# Altium schematic sheet 灯带消消乐.SchDoc
size A2
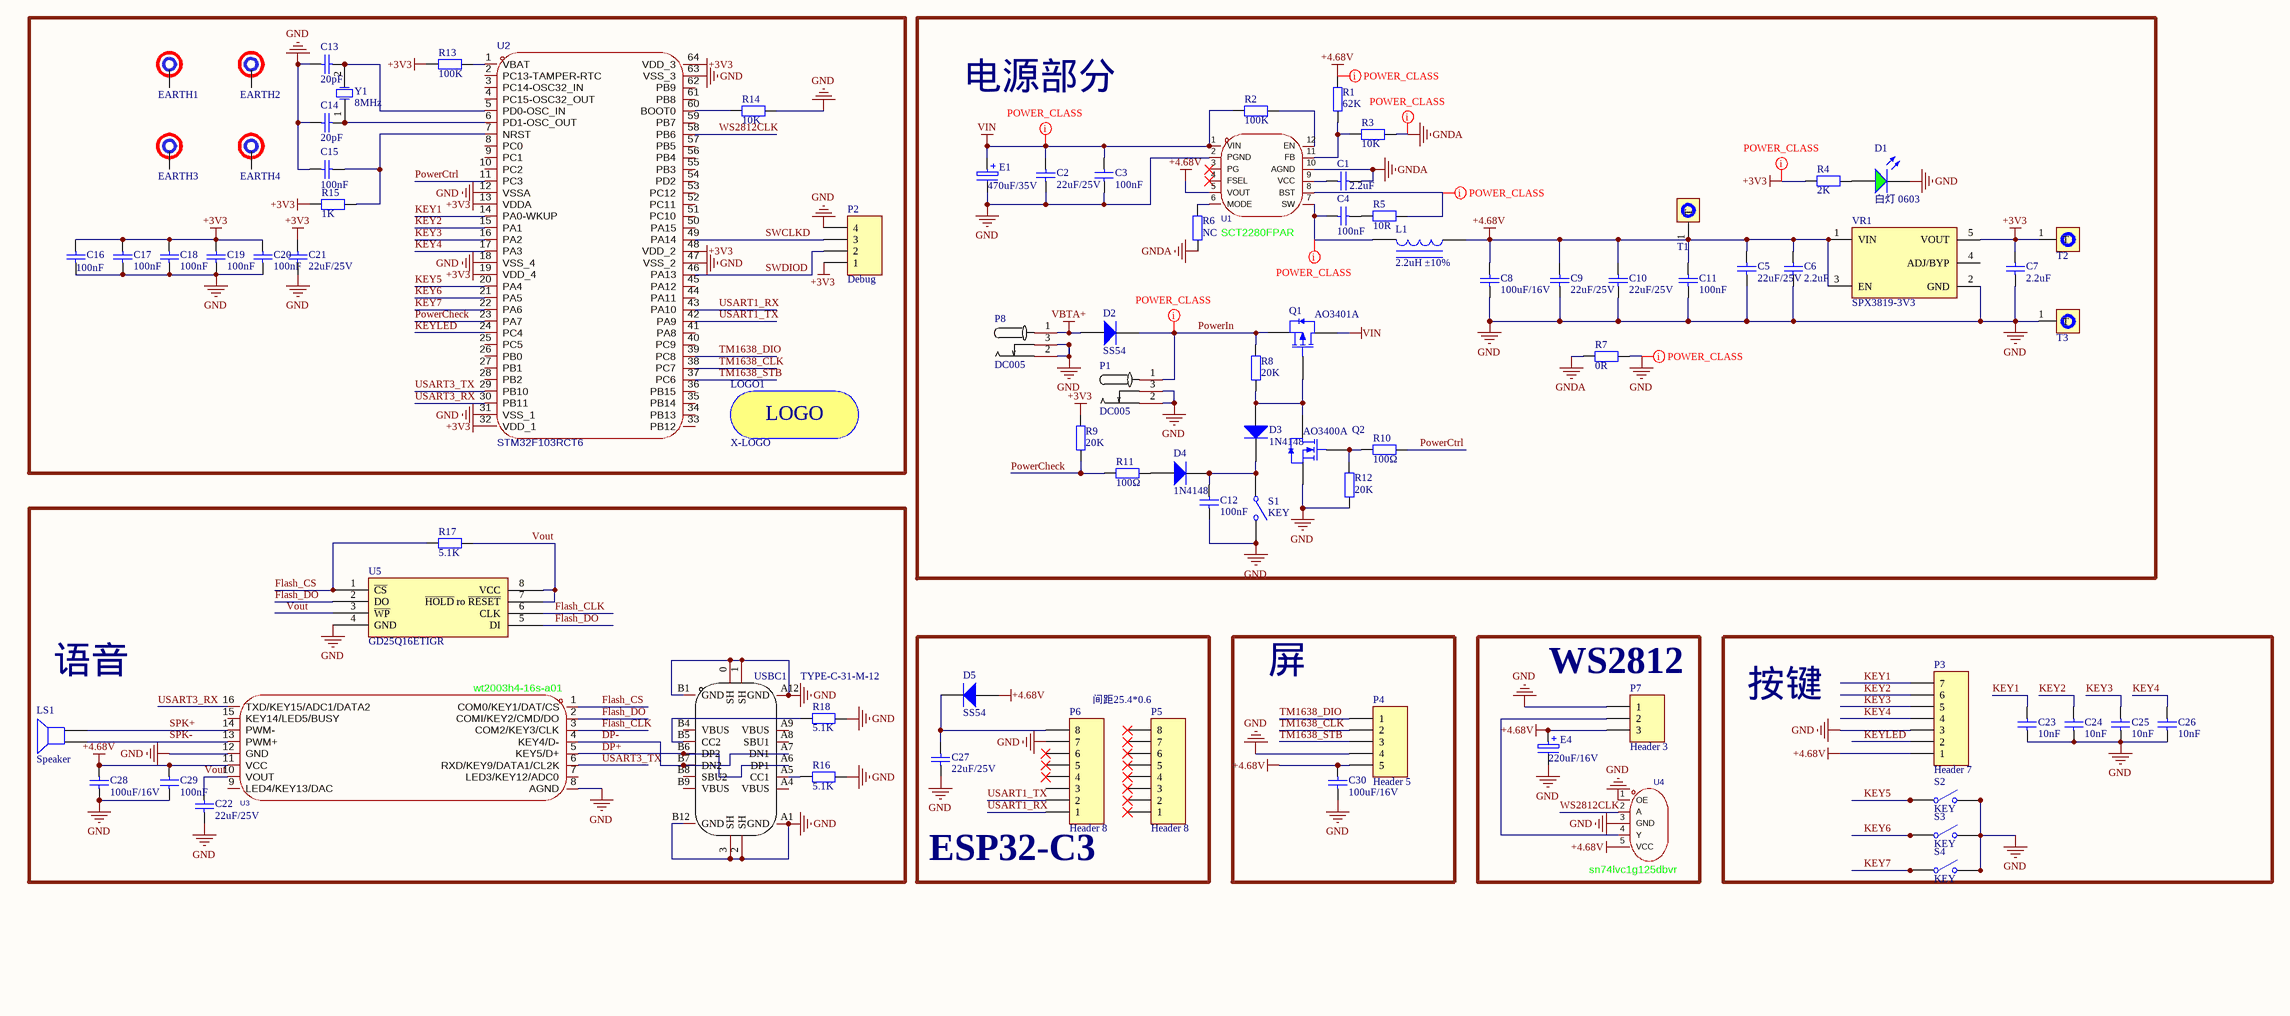
[diagram p0: 灯带消消乐.SchDoc]

## Parts
C1  2.2uF  [0402_C]
C2  22uF/25V  [0805_C]
C3  100nF  [0603_C]
C4  100nF  [0402_C]
C5  22uF/25V  [0805_C]
C6  2.2uF  [0603_C]
C7  2.2uF  [0603_C]
C8  100uF/16V  [1206_C]
C9  22uF/25V  [0805_C]
C10  22uF/25V  [0805_C]
C11  100nF  [0603_C]
C12  100nF  [0603_C]
C13  20pF  [0402_C]
C14  20pF  [0402_C]
C15  100nF  [0402_C]
C16  100nF  [0402_C]
C17  100nF  [0402_C]
C18  100nF  [0402_C]
C19  100nF  [0402_C]
C20  100nF  [0402_C]
C21  22uF/25V  [0805_C]
C22  22uF/25V  [0805_C]
C23  10nF  [0603_C]
C24  10nF  [0603_C]
C25  10nF  [0603_C]
C26  10nF  [0603_C]
C27  22uF/25V  [0805_C]
C28  100uF/16V  [1206_C]
C29  100nF  [0603_C]
C30  100uF/16V  [1206_C]
D1  白灯 0603  [0603_LED_S1]
D2  SS54  [SMA(DO-214AC)_S1]
D3  1N4148  [LL-34]
D4  1N4148  [LL-34]
D5  SS54  [SMA(DO-214AC)_S1]
E1  470uF/35V  [CAP 5.0*10*12.5]
E4  220uF/16V  [CAP 2.5*6.3*11.2]
EARTH1  EARTH  [Mounting Hole 3.2]  (value not drawn)
EARTH2  EARTH  [Mounting Hole 3.2]  (value not drawn)
EARTH3  EARTH  [Mounting Hole 3.2]  (value not drawn)
EARTH4  EARTH  [Mounting Hole 3.2]  (value not drawn)
L1  2.2uH ±10%  [NR8040]
LOGO1  X-LOGO  [XLOGO]
LS1  Speaker  [2.54-2P]
P1  DC005  [DC005]
P2  Debug  [DEBUG]
P3  Header 7  [2.54-7P]
P4  Header 5  [2.54-5P]
P5  Header 8  [HDR1X8]
P6  Header 8  [HDR1X8]
P7  Header 3  [HDR1X3]
P8  DC005  [DC005]
Q1  AO3401A  [SOT-23-3L]
Q2  AO3400A  [SOT-23-3L]
R1  62K  [0402_R]
R2  100K  [0402_R]
R3  10K  [0402_R]
R4  2K  [0603_R]
R5  10R  [0402_R]
R6  NC  [0402_R]
R7  0R  [1206_R]
R8  20K  [0603_R]
R9  20K  [0603_R]
R10  100Ω  [0603_R]
R11  100Ω  [0603_R]
R12  20K  [0603_R]
R13  100K  [0402_R]
R14  10K  [0402_R]
R15  1K  [0402_R]
R16  5.1K  [0603_R]
R17  5.1K  [0603_R]
R18  5.1K  [0603_R]
S1  KEY  [SW-TH_4P-L6.0-W6.0-P4.50-LS6.5]
S2  KEY  [SW-TH_4P-L6.0-W6.0-P4.50-LS6.5]
S3  KEY  [SW-TH_4P-L6.0-W6.0-P4.50-LS6.5]
S4  KEY  [SW-TH_4P-L6.0-W6.0-P4.50-LS6.5]
T1  Test Point  [PLUG]  (value not drawn)
T2  Test Point  [PLUG]  (value not drawn)
T3  Test Point  [PLUG]  (value not drawn)
U1  SCT2280FPAR  [QFN-12_L2.0-W3.0-P0.50-BL]
U2  STM32F103RCT6  [LQFP-64_L10.0-W10.0-P0.50-LS12.0-BL]
U3  wt2003h4-16s-a01  [SOP-16_150mil]
U4  sn74lvc1g125dbvr  [SOT-23-5]
U5  GD25Q16ETIGR  [SOP-8_150mil]
USBC1  TYPE-C-31-M-12  [USB-C_SMD-TYPE-C-31-M-12]
VR1  SPX3819-3V3  [SOT-23-5]
Y1  8MHz  [SMD-5032_2P]

## Blocks framed on the sheet
电源部分: C1-C12 D1-D4 E1 L1 P1 P8 Q1 Q2 R1-R12 S1 T1-T3 U1 VR1
语音: C22 C28 C29 LS1 R16-R18 U3 U5 USBC1
ESP32-C3: C27 D5 P5 P6
屏: C30 P4
WS2812: E4 P7 U4
按键: C23-C26 P3 S2-S4

## Nets
+3V3: C7.2 C16.1 C17.1 C18.1 C19.1 C20.1 C21.2 P2.1 R4.1 R9.2 R13.2 R15.2 T2.1(T) U2.13(VDDA) U2.19(VDD_4) U2.32(VDD_1) U2.48(VDD_2) U2.64(VDD_3) VR1.5(VOUT)
+4.68V: C5.2 C6.2 C8.2 C9.2 C10.2 C11.2 C28.2 C29.2 C30.2 D5.1(A) E4.1 L1.1 P3.1 P4.5 P7.3 R1.2 T1.1(T) U1.5(VOUT) U3.11(VCC) U4.5(VCC) VR1.1(VIN) VR1.3(EN)
GND: C2.1 C3.1 C5.1 C6.1 C7.1 C8.1 C9.1 C10.1 C11.1 C12.1 C13.2 C14.2 C15.1 C16.2 C17.2 C18.2 C19.2 C20.2 C21.1 C22.1 C23.1 C24.1 C25.1 C26.1 C27.1 C28.1 C29.1 C30.1 D1.K E1.2 E4.2 P1.2 P1.3 P2.4 P3.3 P4.4 P6.7 P7.1 P8.2 P8.3 Q2.2(S) R7.2 R12.2 R14.2 R16.1 R18.1 S1.3(NO1) S1.4(NO2) S2.3(NO1) S2.4(NO2) S3.3(NO1) S3.4(NO2) S4.3(NO1) S4.4(NO2) T3.1(T) U1.2(PGND) U2.12(VSSA) U2.18(VSS_4) U2.31(VSS_1) U2.47(VSS_2) U2.63(VSS_3) U3.8(AGND) U3.12(GND) U4.1(OE) U4.3(GND) U5.4(GND) USBC1.0(SH) USBC1.1(SH) USBC1.2(SH) USBC1.3(SH) USBC1.A1(GND) USBC1.A12(GND) USBC1.B1(GND) USBC1.B12(GND) VR1.2(GND)
GNDA: C1.1 R3.2 R6.2 R7.1 U1.10(AGND)
VBTA+: D2.1(A) P8.1
VIN: C2.2 C3.2 E1.1 Q1.3(D) R2.1 U1.1(VIN)
DP+: U3.5(KEY5/D+) USBC1.A6(DP1) USBC1.B6(DP2)
DP-: U3.4(KEY4/D-) USBC1.A7(DN1) USBC1.B7(DN2)
Flash_CLK: U3.3(COM2/KEY3/CLK) U5.6(CLK)
Flash_CS: R17.2 U3.1(COM0/KEY1/DAT/CS) U5.1(~{CS})
Flash_DO: U3.2(COMI/KEY2/CMD/DO) U5.2(DO) U5.5(DI)
KEY1: C23.2 P3.7 U2.14(PA0-WKUP)
KEY2: C24.2 P3.6 U2.15(PA1)
KEY3: C25.2 P3.5 U2.16(PA2)
KEY4: C26.2 P3.4 U2.17(PA3)
KEY5: S2.1(COMMON1) S2.2(COMMON2) U2.20(PA4)
KEY6: S3.1(COMMON1) S3.2(COMMON2) U2.21(PA5)
KEY7: S4.1(COMMON1) S4.2(COMMON2) U2.22(PA6)
KEYLED: P3.2 U2.24(PC4)
PowerCheck: R9.1 R11.1 U2.23(PA7)
PowerCtrl: R10.2 U2.11(PC3)
PowerIn: D2.2(K) P1.1 Q1.2(S) R8.1
SPK+: LS1.1 U3.14(PWM-)
SPK-: LS1.2 U3.13(PWM+)
SWCLKD: P2.3 U2.49(PA14)
SWDIOD: P2.2 U2.46(PA13)
TM1638_CLK: P4.2 U2.38(PC7)
TM1638_DIO: P4.1 U2.39(PC8)
TM1638_STB: P4.3 U2.37(PC6)
USART1_RX: P6.1 U2.43(PA10)
USART1_TX: P6.2 U2.42(PA9)
USART3_RX: U2.30(PB11) U3.16(TXD/KEY15/ADC1/DATA2)
USART3_TX: U2.29(PB10) U3.6(RXD/KEY9/DATA1/CL2K)
Vout: C22.2 R17.1 U3.10(VOUT) U5.3(~{WP}) U5.7(~{HOLD}_ro_~{RESET}) U5.8(VCC)
WS2812CLK: U2.58(PB6) U4.2(A)
NetC1_2: C1.2 U1.9(VCC)
NetC4_1: C4.1 R5.1
NetC4_2: C4.2 L1.2 U1.7(SW)
NetC12_2: C12.2 D3.2(K) D4.2(K) S1.1(COMMON1) S1.2(COMMON2)
NetC13_1: C13.1 U2.5(PD0-OSC_IN) Y1.2(OSC2)
NetC14_1: C14.1 U2.6(PD1-OSC_OUT) Y1.1(OSC1)
NetC15_2: C15.2 R15.1 U2.7(NRST)
NetC27_2: C27.2 D5.2(K) P6.8
NetD1_A: D1.A R4.2
NetD3_1: D3.1(A) Q1.1(G) Q2.3(D) R8.2
NetD4_1: D4.1(A) R11.2
NetP7_2: P7.2 U4.4(Y)
NetQ2_1: Q2.1(G) R10.1 R12.1
NetR1_1: R1.1 R3.1 U1.11(FB)
NetR2_2: R2.2 U1.12(EN)
NetR5_2: R5.2 U1.8(BST)
NetR6_1: R6.1 U1.6(MODE)
NetR13_1: R13.1 U2.1(VBAT)
NetR14_1: R14.1 U2.60(BOOT0)
NetR16_2: R16.2 USBC1.A5(CC1)
NetR18_2: R18.2 USBC1.B5(CC2)

Not connected (* = marked no-connect by the designer): EARTH1 1(E); EARTH2 1(E); EARTH3 1(E); EARTH4 1(E); P5 1* 2* 3* 4* 5* 6* 7* 8*; P6 3 4* 5* 6*; U1 3(PG)* 4(FSEL)*; U2 2(PC13-TAMPER-RTC) 3(PC14-OSC32_IN) 4(PC15-OSC32_OUT) 8(PC0) 9(PC1) 10(PC2) 25(PC5) 26(PB0) 27(PB1) 28(PB2) 33(PB12) 34(PB13) 35(PB14) 36(PB15) 40(PC9) 41(PA8) 44(PA11) 45(PA12) 50(PA15) 51(PC10) 52(PC11) 53(PC12) 54(PD2) 55(PB3) 56(PB4) 57(PB5) 59(PB7) 61(PB8) 62(PB9); U3 7(LED3/KEY12/ADC0) 9(LED4/KEY13/DAC) 15(KEY14/LED5/BUSY); USBC1 A4(VBUS) A8(SBU1) A9(VBUS) B4(VBUS) B8(SBU2) B9(VBUS); VR1 4(ADJ/BYP)

## Layout directives
net class POWER: +3V3, +4.68V, GND, GNDA, NetC4_2, NetR5_2, PowerIn, VIN

## Notes on the sheet
- 间距25.4*0.6
- Title
- Size:
- Date:
- File:
- A2
- Number:
- Time:
- Revision:
- Sheet
- of

## Library data of the parts
C1-C30 = Cap: 贴片电容
D1 = 0603 绿灯: 发光二极管; ComponentLink1Description: 供应商链接; ComponentLink1URL: http://www.szlcsc.com/product/details_73152.html; Package: 0603; Supplier: LC; SuppliersPartNumber: C72043
D2-D5 = SMA(DO-214AC) SS54: 二极管; ComponentLink1Description: 供应商链接; ComponentLink1URL: http://www.szlcsc.com/product/details_23178.html; Package: SMA(DO-214AC); Supplier: LC; SuppliersPartNumber: C22452
E1 E4 = ECAP: 电解电容; pin to pad: 1>A 2>K
EARTH1-EARTH4 = Mounting Hole
L1 = 1206 10uH 10%: 贴片电感; ComponentLink1Description: 供应商链接; ComponentLink1URL: http://www.szlcsc.com/product/details_1403.html; Package: 1206; Supplier: LC; SuppliersPartNumber: C1051
LOGO1 = LOGO
LS1 = Speaker: Loudspeaker; Published: 24-Mar-1999; LatestRevisionDate: 17-Jul-2002; LatestRevisionNote: Re-released for DXP Platform.; PackageReference: PIN2; Publisher: Altium Limited
P2 = Header 4: Header, 4-Pin; LatestRevisionDate: 17-Jul-2002; LatestRevisionNote: Re-released for DXP Platform.; Publisher: Altium Limited
P3 = Header 7: Header, 7-Pin; LatestRevisionDate: 17-Jul-2002; LatestRevisionNote: Re-released for DXP Platform.; Publisher: Altium Limited
P4 = Header 5: Header, 5-Pin; LatestRevisionDate: 17-Jul-2002; LatestRevisionNote: Re-released for DXP Platform.; Publisher: Altium Limited
P5 P6 = Header 8: Header, 8-Pin; LatestRevisionDate: 17-Jul-2002; LatestRevisionNote: Re-released for DXP Platform.; Publisher: Altium Limited
P7 = Header 3: Header, 3-Pin; LatestRevisionDate: 17-Jul-2002; LatestRevisionNote: Re-released for DXP Platform.; Publisher: Altium Limited
Q1 = AO3401A P道沟 X13A15 SOT-23: MOS(场效应管); ComponentLink1Description: 供应商链接; ComponentLink1URL: http://www.szlcsc.com/product/details_15801.html; Package: SOT-23; Supplier: LC; SuppliersPartNumber: C15127
Q2 = AO3400A N道沟 X0YV1T SOT-23: MOS(场效应管); ComponentLink1Description: 供应商链接; ComponentLink1URL: http://www.szlcsc.com/product/details_21629.html; Package: SOT-23; Supplier: LC; SuppliersPartNumber: C20917
R1-R18 = Res: 贴片电阻
S1-S4 = SWITCH
U1 = SCT2280FPAR: 功能类型:降压型;工作电压:4.5V~18V;输出电压:600mV~7V;输出电流:8A;输出类型:可调;; Manufacturer: SCT(芯洲科技); AddInBom: yes; ModelId: 0ae59447a7924f2e9e6865042a3e138b; ModelTransform: 118.8974,80.3148,0,0,0,0,0,-4.016,0; Function: 降压型; Output Current: 8A; Frequency - Switching: 400kHz~1.2MHz; Synchronous Rectifier: 是; Number of Outputs: 1; Topology: 降压式; Quiescent Current: 130uA; Switch tube (built-in/external): 内置; Output Type: 可调; Symbol: SCT2280FPAR; LCSC Part Name: 降压型 8A 4.5V~18V; SupplierPart: C918192; ManufacturerPart: SCT2280FPAR; Supplier Footprint: QFN-12(2x3); JLCPCB Part Class: Extended Part; Datasheet: https://item.szlcsc.com/datasheet/SCT2280FPAR/994012.html; Supplier: LCSC; ConvertToPcb: yes; FootprintName: QFN-12_L2.0-W3.0-P0.50-BL; ModelName: QFN-12_L2.0-W3.0-P0.50-BL; Voltage - Supply: 4.5V~18V; Output Voltage: 600mV~7V; Operating Temperature: -40℃~+125℃; Features: 轻载高效模式；内置LDO稳压器；逐波限流；过流保护；输出放电；工作状态指示；打嗝限流
U2 = STM32F103RCT6: CPU内核:ARM-M3;CPU最大主频:72MHz;应用领域:-;; Manufacturer: ST(意法半导体); AddInBom: yes; ModelId: cd9de06618c44fcf82654c43a457f83c; ModelName: LQFP-64_L10.0-W10.0-H1.4-LS12.0-P0.50; ModelTransform: 472.441,472.441,0,0,0,0,0,0,0; CPU Core: ARM-M3; CPU Maximum Speed: 72MHz; Program Storage Size: 256KB; Program Memory Type: FLASH; Number of I/O: 51; ADC (Bit): 12bit; Voltage - Supply: 2V~3.6V; Symbol: STM32F103RCT6; Device: STM32F103RCT6; LCSC Part Name: 主流增强型ARM Cortex-M3 MCU，具有256 KB Flash、72 MHz CPU、电机控制、USB和CAN; SupplierPart: C8323; ManufacturerPart: STM32F103RCT6; Supplier Footprint: LQFP-64(10x10); JLCPCB Part Class: Extended Part; Datasheet: https://item.szlcsc.com/datasheet/STM32F103RCT6/8815.html; Supplier: LCSC; ConvertToPcb: yes; FootprintName: LQFP-64_L10.0-W10.0-P0.50-LS12.0-BL; DAC (Bit): 12bit; Applications: -
U3 = wt2003h4-16s-a04: WT2003HX是一款功能强大的高品质语音芯片，采用了高性能32位处理器、最高频率可达120MHz。标准UART通信方式，具有低成本、低功耗、高可靠性、通用性强等特点，可内置350秒语音容量。可通过下载器或者MCU更新语音bin文件，实现语音OTA功能。可搭配 WT WriterV 下载器（适配WT2003H系列、WTV380/WTV890系列、WT3000T系列、WTK6900系列、WT2605A系列、WT2605C系列芯片，实现语音 / 程序的下载与更换）及 WTV-VSB 测试板（适配 WTV 系列; Manufacturer: WT(唯创知音); AddInBom: yes; ModelId: ee0e272ebf01490fae8942030b5217f4; ModelName: SOP-16_L10.0-W4.0-P1.27-LS6.0-BL; ModelTransform: 393.7,236.22,0,0,0,0,0,0,0; LCSC Part Name: WT2003H4-16S-A04; SupplierPart: C55213602; ManufacturerPart: WT2003H4-16S-A04; Supplier Footprint: SOP-16; JLCPCB Part Class: Extended Part; Datasheet: https://item.szlcsc.com/datasheet/WT2003H4-16S-A04/59048000.html; Supplier: LCSC; ConvertToPcb: yes; SymbolName: WT2003H4-16S-A04; FootprintName: SOP-16_L10.0-W4.0-P1.27-LS6.0-BL
U4 = sn74lvc1g125dbvr: 输入类型:-;工作电压:1.65V~5.5V;元件数:1;每个元件位数:1;灌电流(IOL):32mA;拉电流(IOH):32mA;; Manufacturer: TI(德州仪器); AddInBom: yes; ModelId: 0a2a1b8f50944f73965918ad6e5fe167; ModelName: SOT-23-5_L2.9-W1.6-H1.1-LS2.8-P0.95; ModelTransform: 118.60433,114.173,0,90,0,0,0.0005,0.0005,0; output type: 三态; Number of Elements: 1; Channel Type: 单向; Current - Output Low(IOL): 32mA; Logic Family: 74LVC; Quiescent Current: 10uA; Propagation Delay: 3.7ns@3.3V,15pF; Symbol: SN74LVC1G125DBVR; LCSC Part Name: 单总线缓冲门，带三态输出; SupplierPart: C23654; ManufacturerPart: SN74LVC1G125DBVR; Supplier Footprint: SOT-23-5; JLCPCB Part Class: Extended Part; Datasheet: https://www.ti.com/cn/lit/ds/symlink/sn74lvc1g125.pdf; Supplier: LCSC; ConvertToPcb: yes; FootprintName: SOT-23-5_L3.0-W1.7-P0.95-LS2.8-BL; Input type: -; Voltage - Supply: 1.65V~5.5V; Number of Bits per Element: 1; Current - Output High(IOH): 32mA; Operating Temperature: -40℃~+125℃; Features: 掉电隔离；输出使能
U5 = W25Q128FVSIG_[C35101]: Flash ROM; ComponentLink1Description: 供应商链接; ComponentLink1URL: http://www.szlcsc.com/product/details_36072.html; Package: SOIC-8; Supplier: LC; SuppliersPartNumber: C35101
USBC1 = TYPE-C-31-M-12: Manufacturer: 韩国韩荣; Add into BOM: yes; Connector Type: Type-C; Gender: 母; Number of Contacts: 16P; Number of Ports: 1; Current Rating - Power (Max): 5A; Symbol: TYPE-C-31-M-12; Device: TYPE-C-31-M-12; Supplier: LCSC; Supplier Part: C165948; Manufacturer Part: TYPE-C-31-M-12; JLCPCB Part Class: Extended Part; LCSC Part Name: Type-C 母; Supplier Footprint: SMD; Datasheet: https://atta.szlcsc.com/upload/public/pdf/source/20220525/466408E853115E789EDB0DDC29077C05.pdf; Convert to PCB: yes; Standard: -; Mounting Style: -; Contact Material: -; Contact Plating: -; Operating Temperature Range: -; Welding Temperature (Max): -; Name: TYPE-C-31-M-12
VR1 = SPX3819: LDO-3.3V
Y1 = SMD-5032_2P 8MHz 20ppm 20pF: 贴片晶振; ComponentLink1Description: 供应商链接; ComponentLink1URL: http://www.szlcsc.com/product/details_117214.html; Package: SMD-5032_2P; Supplier: LC; SuppliersPartNumber: C115962